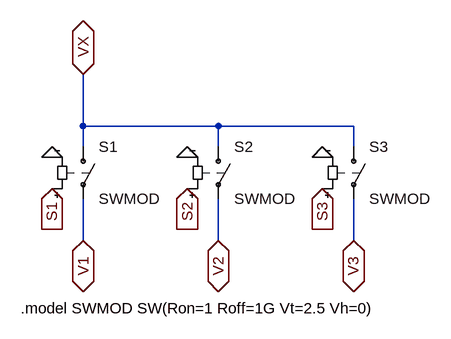
[diagram p0: schematic SW3.asc]
SW3.asc, the LTspice schematic file:
Version 4.1
SHEET 1 880 680
WIRE 128 96 128 16
WIRE 336 96 128 96
WIRE 544 96 336 96
WIRE 128 128 128 96
WIRE 336 128 336 96
WIRE 544 128 544 96
WIRE 128 272 128 208
WIRE 336 272 336 208
WIRE 544 272 544 208
FLAG 80 144 0
FLAG 288 144 0
FLAG 496 144 0
FLAG 80 192 S1
IOPIN 80 192 In
FLAG 288 192 S2
IOPIN 288 192 In
FLAG 496 192 S3
IOPIN 496 192 In
FLAG 128 272 V1
IOPIN 128 272 BiDir
FLAG 336 272 V2
IOPIN 336 272 BiDir
FLAG 544 272 V3
IOPIN 544 272 BiDir
FLAG 128 16 VX
IOPIN 128 16 BiDir
SYMBOL sw 128 112 R0
SYMATTR InstName S1
SYMATTR Value SWMOD
SYMBOL sw 336 112 R0
SYMATTR InstName S2
SYMATTR Value SWMOD
SYMBOL sw 544 112 R0
SYMATTR InstName S3
SYMATTR Value SWMOD
TEXT 32 376 Left 2 !.model SWMOD SW(Ron=1 Roff=1G Vt=2.5 Vh=0)

The netlist it stands for:
* SW3.asc
S1 VX V1 S1 0 SWMOD
S2 VX V2 S2 0 SWMOD
S3 VX V3 S3 0 SWMOD
.model SWMOD SW(Ron=1 Roff=1G Vt=2.5 Vh=0)
.backanno
.end